# Altium schematic sheet Sheet1.SchDoc
size A4; Author: Daniel Schunin; SheetNumber: 1; SheetTotal: 1
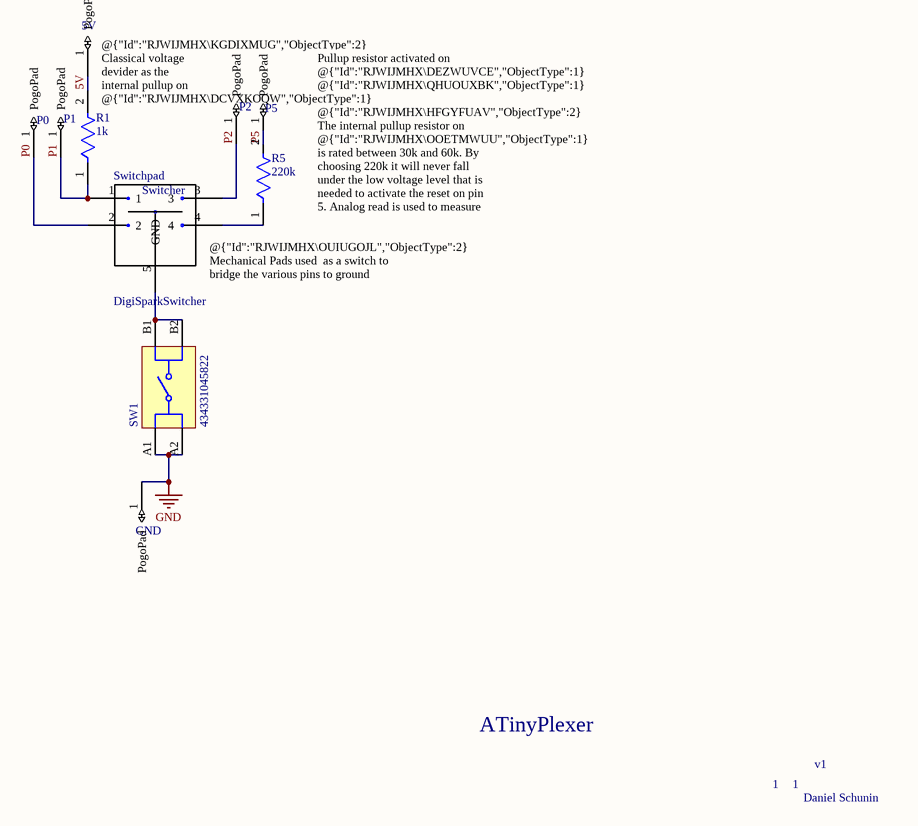
[diagram p0: Sheet1.SchDoc]

## Parts
5V  (no value)  [Pogopin_pad_female_2mm]
GND  (no value)  [Pogopin_pad_female_2mm]
P0  (no value)  [Pogopin_pad_female_2mm]
P1  (no value)  [Pogopin_pad_female_2mm]
P2  (no value)  [Pogopin_pad_female_2mm]
P5  (no value)  [Pogopin_pad_female_2mm]
R1  1k  [FP-RMCF1206-IPC_C]
R5  220k  [FP-RMCF1206-IPC_C]
SW1  434331045822  [434331045822]
Switchpad  DigiSparkSwitcher  [DigiSparkSwitcher]

## Nets
GND: GND.1(PogoPad) SW1.A1 SW1.A2
5V: 5V.1(PogoPad) R1.2
P0: P0.1(PogoPad) Switchpad.2
P1: P1.1(PogoPad) R1.1 Switchpad.1
P2: P2.1(PogoPad) Switchpad.3
P5: P5.1(PogoPad) R5.2
NetR5_1: R5.1 Switchpad.4
NetSW1_B1: SW1.B1 SW1.B2 Switchpad.5(GND)

## Notes on the sheet
- @{"Id":"RJWIJMHX\KGDIXMUG","ObjectType":2} Classical voltage devider as the internal pullup on @{"Id":"RJWIJMHX\DCVXKOQW","ObjectType":1} has a led wired in and cant be used for a button.
- Pullup resistor activated on @{"Id":"RJWIJMHX\DEZWUVCE","ObjectType":1} @{"Id":"RJWIJMHX\QHUOUXBK","ObjectType":1} @{"Id":"RJWIJMHX\OOETMWUU","ObjectType":1}
- @{"Id":"RJWIJMHX\HFGYFUAV","ObjectType":2} The internal pullup resistor on @{"Id":"RJWIJMHX\OOETMWUU","ObjectType":1} is rated between 30k and 60k. By choosing 220k it will never fall under the low voltage level that is needed to activate the reset on pin 5. Analog read is used to measure the voltage drop on button press.
  5V * (220k)/(220k + 60k) = 3.92V
- @{"Id":"RJWIJMHX\OUIUGOJL","ObjectType":2} Mechanical Pads used  as a switch to bridge the various pins to ground
- ATinyPlexer
- 1
- v1
- Daniel Schunin
- (in symbol DigiSparkSwitcher) Switcher

## Library data of the parts
5V GND P0-P2 P5 = PogoPinPad: Simple pad for the pogo pin to make contact with
R1 R5 = CMP-26527-000314-1: 1206; Tolerance: 5%; Temperature Coefficient: 200ppm/°C; Resistance: 3.9MR; Max Power Dissipation: 250mW; Width: 0.063inch; Radiation Hardening: No; Length: 0.126inch; Case/Package: 1206; Max Operating Temperature: 155°C; Min Operating Temperature: -55°C; Mount: Surface Mount; Packaging: Tape and Reel; Height: 0.028inch; RoHS Compliant: Yes; Series: RMCF; Resistor Type: Thick Film; Features: Automotive AEC-Q200; Contact Plating: Tin; Number of Terminations: 2
SW1 = CMP-1461-00001-3: Switch Tactile Spst-no 0.05A 12V; Insulation Resistance: 100MΩ; Operating Force: 2.16N; Current Rating: 50mA; Contact Plating: Silver; Height: 1.65mm; Width: 4.7mm; Voltage Rating: 12V; RoHS: Compliant; Max Operating Temperature: 85°C; Packaging: Tape and Reel; Min Operating Temperature: -40°C; Contact Resistance: 100mΩ; Contact Current Rating: 50mA